# Altium schematic sheet Carrier_Board_real.SchDoc
size 381 x 304 mm; SheetNumber: 1; SheetTotal: 1
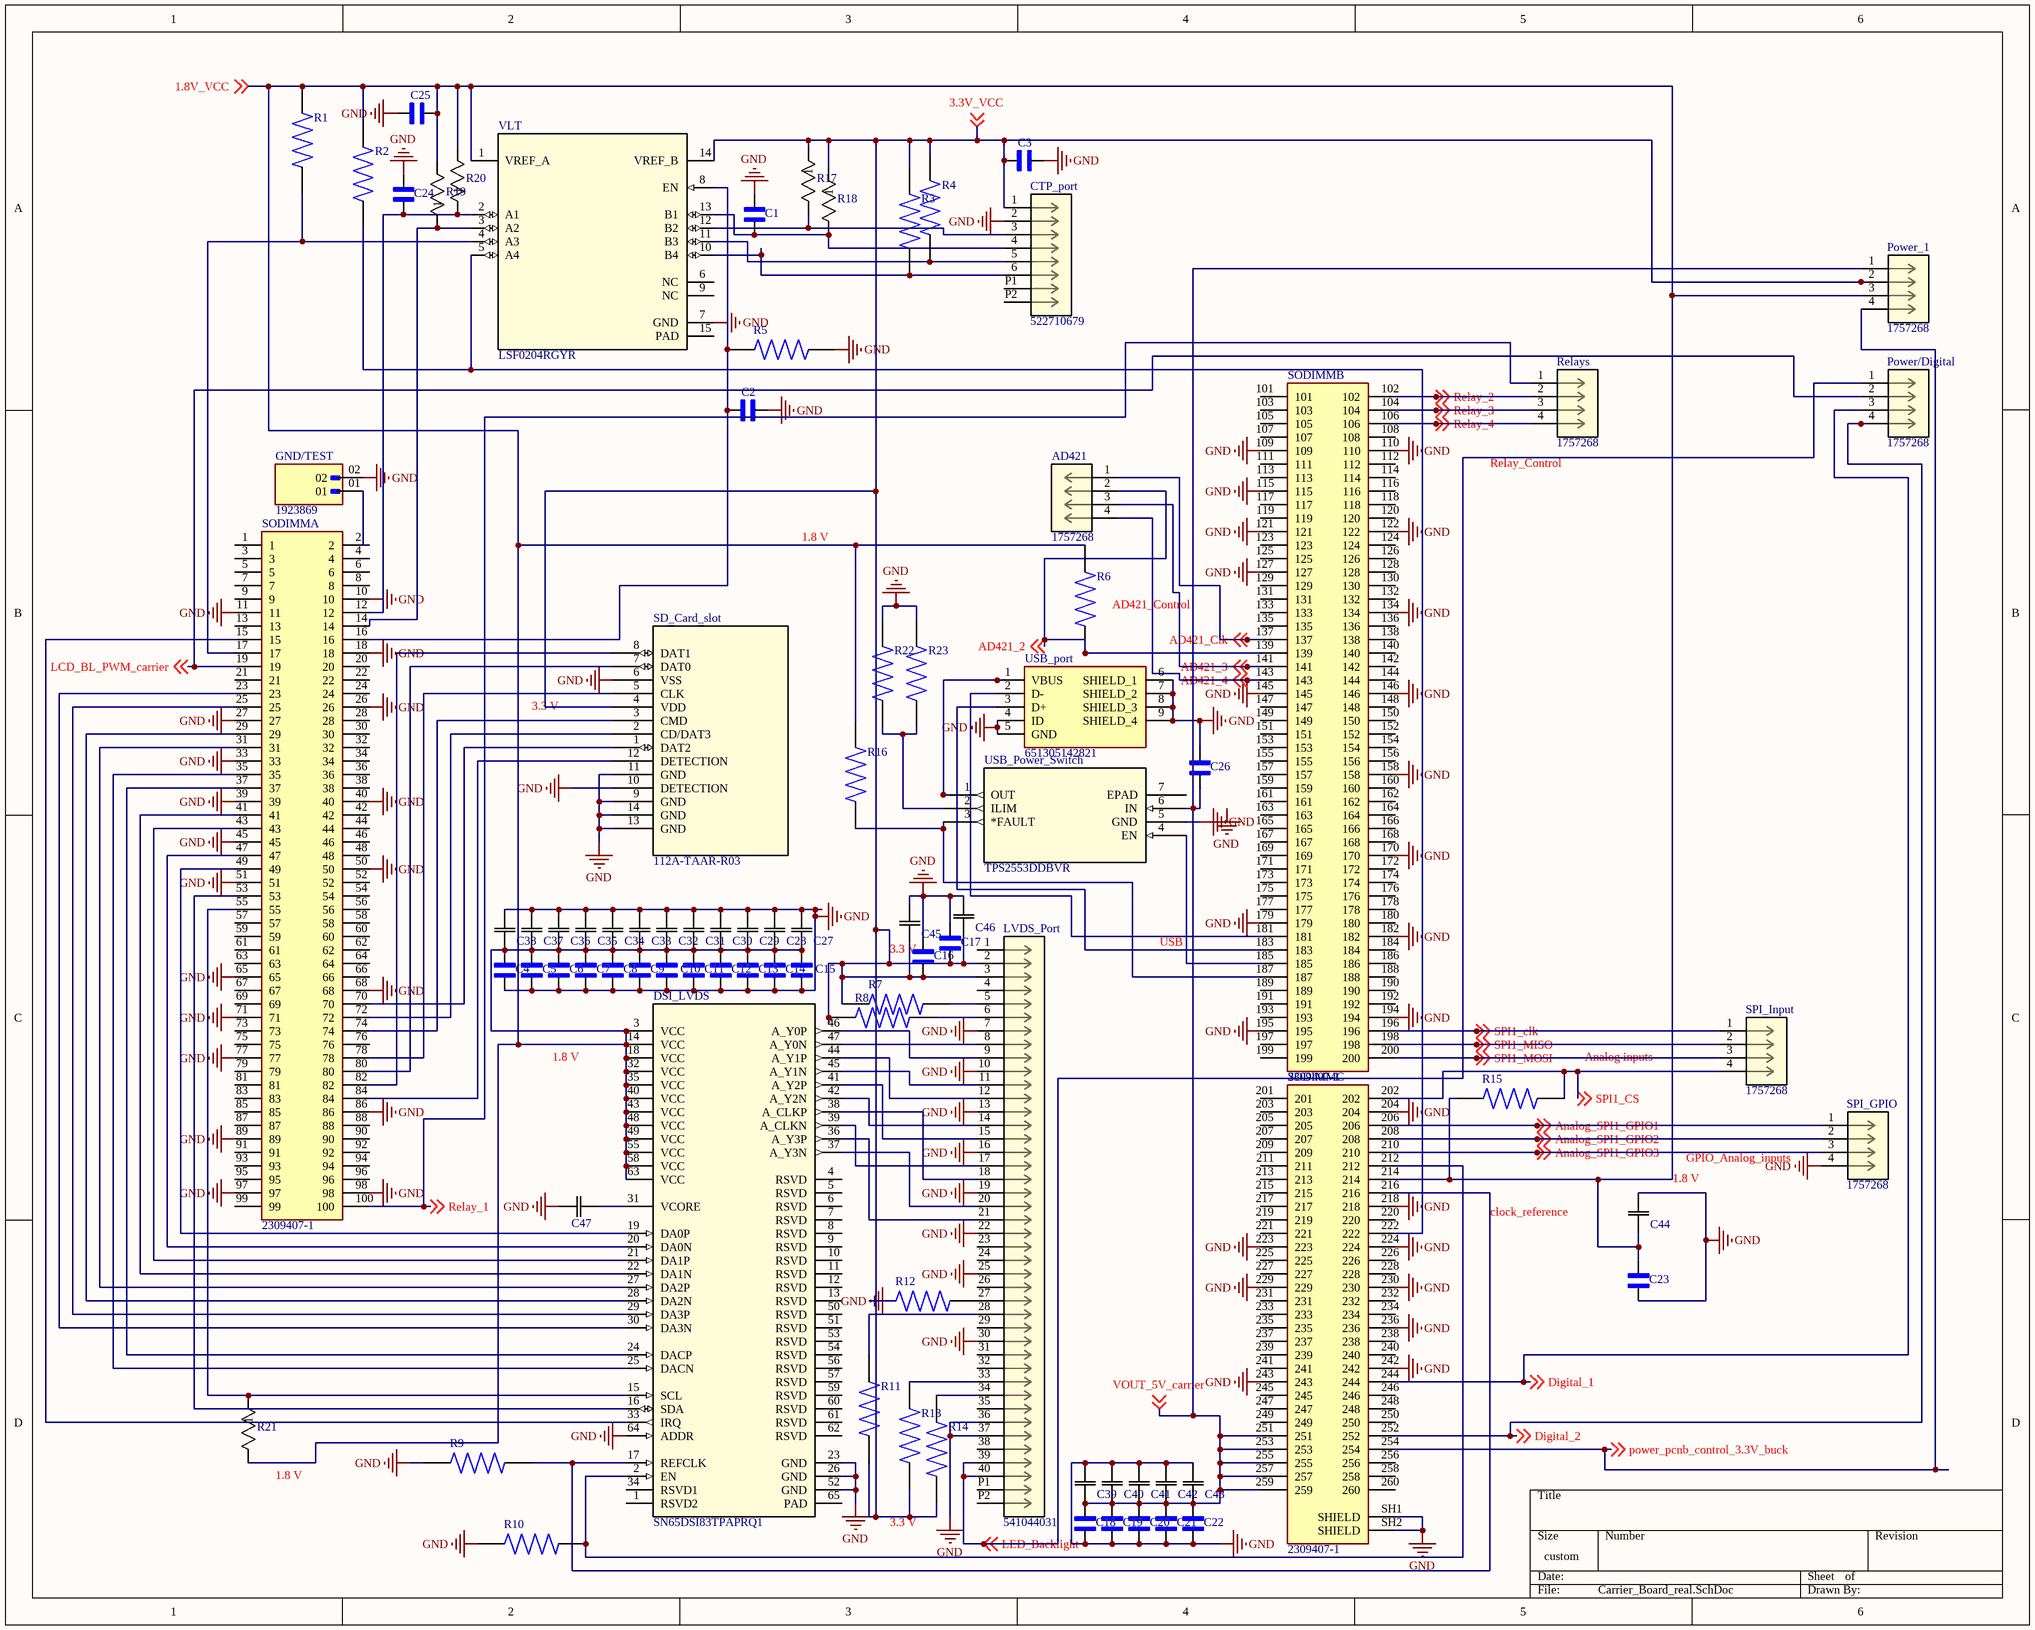
[diagram p0: Carrier_Board_real.SchDoc]

## Parts
AD421  1757268  [CONN_1757268_PXC]
C1  100n  [CAPC1608X90]  (value not drawn)
C2  100n  [CAPC1608X90]  (value not drawn)
C3  100n  [CAPC1608X90]  (value not drawn)
C4  100n  [CAPC1608X90]  (value not drawn)
C5  100n  [CAPC1608X90]  (value not drawn)
C6  100n  [CAPC1608X90]  (value not drawn)
C7  100n  [CAPC1608X90]  (value not drawn)
C8  100n  [CAPC1608X90]  (value not drawn)
C9  100n  [CAPC1608X90]  (value not drawn)
C10  100n  [CAPC1608X90]  (value not drawn)
C11  100n  [CAPC1608X90]  (value not drawn)
C12  100n  [CAPC1608X90]  (value not drawn)
C13  100n  [CAPC1608X90]  (value not drawn)
C14  100n  [CAPC1608X90]  (value not drawn)
C15  100n  [CAPC1608X90]  (value not drawn)
C16  100n  [CAPC1608X90]  (value not drawn)
C17  100n  [CAPC1608X90]  (value not drawn)
C18  100n  [CAPC1608X90]  (value not drawn)
C19  100n  [CAPC1608X90]  (value not drawn)
C20  100n  [CAPC1608X90]  (value not drawn)
C21  100n  [CAPC1608X90]  (value not drawn)
C22  100n  [CAPC1608X90]  (value not drawn)
C23  100n  [CAPC1608X90]  (value not drawn)
C24  100n  [CAPC1608X90]  (value not drawn)
C25  100n  [CAPC1608X90]  (value not drawn)
C26  100n  [CAPC1608X90]  (value not drawn)
C27  10u  [CAP_2012_TDK]  (value not drawn)
C28  10u  [CAP_2012_TDK]  (value not drawn)
C29  10u  [CAP_2012_TDK]  (value not drawn)
C30  10u  [CAP_2012_TDK]  (value not drawn)
C31  10u  [CAP_2012_TDK]  (value not drawn)
C32  10u  [CAP_2012_TDK]  (value not drawn)
C33  10u  [CAP_2012_TDK]  (value not drawn)
C34  10u  [CAP_2012_TDK]  (value not drawn)
C35  10u  [CAP_2012_TDK]  (value not drawn)
C36  10u  [CAP_2012_TDK]  (value not drawn)
C37  10u  [CAP_2012_TDK]  (value not drawn)
C38  10u  [CAP_2012_TDK]  (value not drawn)
C39  10u  [CAP_2012_TDK]  (value not drawn)
C40  10u  [CAP_2012_TDK]  (value not drawn)
C41  10u  [CAP_2012_TDK]  (value not drawn)
C42  10u  [CAP_2012_TDK]  (value not drawn)
C43  10u  [CAP_2012_TDK]  (value not drawn)
C44  10u  [CAP_2012_TDK]  (value not drawn)
C45  10u  [CAP_2012_TDK]  (value not drawn)
C46  10u  [CAP_2012_TDK]  (value not drawn)
C47  1u  [CAPC17595_90N_KEM]  (value not drawn)
CTP_port  522710679  [CON_522710679_MOL]
DSI_LVDS  SN65DSI83TPAPRQ1  [PAP0064Q_N]
GND/TEST  1923869  [PHOENIX_1923869]
LVDS_Port  541044031  [CON_541044031_MOL]
Power/Digital  1757268  [CONN_1757268_PXC]
Power_1  1757268  [CONN_1757268_PXC]
R1  10k  [RESC2012X60N]  (value not drawn)
R2  10k  [RESC2012X60N]  (value not drawn)
R3  10k  [RESC2012X60N]  (value not drawn)
R4  10k  [RESC2012X60N]  (value not drawn)
R5  10k  [RESC2012X60N]  (value not drawn)
R6  10k  [RESC2012X60N]  (value not drawn)
R7  10k  [RESC2012X60N]  (value not drawn)
R8  10k  [RESC2012X60N]  (value not drawn)
R9  10k  [RESC2012X60N]  (value not drawn)
R10  10k  [RESC2012X60N]  (value not drawn)
R11  10k  [RESC2012X60N]  (value not drawn)
R12  10k  [RESC2012X60N]  (value not drawn)
R13  10k  [RESC2012X60N]  (value not drawn)
R14  10k  [RESC2012X60N]  (value not drawn)
R15  10k  [RESC2012X60N]  (value not drawn)
R16  10k  [RESC2012X60N]  (value not drawn)
R17  4.7k  [RES_RC0805_YAG]  (value not drawn)
R18  4.7k  [RES_RC0805_YAG]  (value not drawn)
R19  4.7k  [RES_RC0805_YAG]  (value not drawn)
R20  4.7k  [RES_RC0805_YAG]  (value not drawn)
R21  4.7k  [RES_RC0805_YAG]  (value not drawn)
R22  100k  [RESC1608X55N]  (value not drawn)
R23  100k  [RESC1608X55N]  (value not drawn)
Relays  1757268  [CONN_1757268_PXC]
SD_Card_slot  112A-TAAR-R03  [CONN8_-TAAR-R03_ATT]
SODIMM  2309407-1  [TE_2309407-1]  (parts A,B,C of 3)
SPI_GPIO  1757268  [CONN_1757268_PXC]
SPI_Input  1757268  [CONN_1757268_PXC]
USB_port  651305142821  [651305142821]
USB_Power_Switch  TPS2553DDBVR  [DRV6_1P6X1_TEX]
VLT  LSF0204RGYR  [RGY0014A]

## Nets
GND: C1.1 C2.1 C3.1 C4.2 C5.2 C6.2 C7.2 C8.2 C9.2 C10.2 C11.2 C12.2 C13.2 C14.2 C15.2 C16.1 C17.1 C18.2 C19.2 C20.2 C21.2 C22.2 C23.2 C24.1 C25.1 C26.1 C27.2 C28.2 C29.2 C30.2 C31.2 C32.2 C33.2 C34.2 C35.2 C36.2 C37.2 C38.2 C39.2 C40.2 C41.2 C42.2 C43.2 C44.2 C45.2 C46.2 C47.1 CTP_port.2 DSI_LVDS.23(GND) DSI_LVDS.26(GND) DSI_LVDS.52(GND) DSI_LVDS.64(ADDR) GND/TEST.02 LVDS_Port.7 LVDS_Port.10 LVDS_Port.13 LVDS_Port.16 LVDS_Port.19 LVDS_Port.22 LVDS_Port.25 LVDS_Port.30 LVDS_Port.36 LVDS_Port.37 R5.2 R9.1 R10.1 R12.1 R22.2 R23.2 SD_Card_slot.6(VSS) SD_Card_slot.9(GND) SD_Card_slot.10(DETECTION) SD_Card_slot.11(GND) SD_Card_slot.13(GND) SD_Card_slot.14(GND) SODIMM.10 SODIMM.11 SODIMM.18 SODIMM.26 SODIMM.27 SODIMM.33 SODIMM.39 SODIMM.40 SODIMM.45 SODIMM.50 SODIMM.51 SODIMM.65 SODIMM.68 SODIMM.71 SODIMM.77 SODIMM.86 SODIMM.89 SODIMM.97 SODIMM.98 SODIMM.109 SODIMM.110 SODIMM.115 SODIMM.121 SODIMM.122 SODIMM.127 SODIMM.134 SODIMM.145 SODIMM.146 SODIMM.158 SODIMM.170 SODIMM.179 SODIMM.182 SODIMM.194 SODIMM.195 SODIMM.204 SODIMM.218 SODIMM.223 SODIMM.224 SODIMM.229 SODIMM.230 SODIMM.236 SODIMM.242 SODIMM.243 SODIMM.SH1(SHIELD) SODIMM.SH2(SHIELD) SPI_GPIO.4 USB_port.4(ID) USB_port.5(GND) USB_port.6(SHIELD_1) USB_port.7(SHIELD_2) USB_port.8(SHIELD_3) USB_port.9(SHIELD_4) USB_Power_Switch.5(GND) VLT.7(GND)
1.8V_VCC: C4.1 C5.1 C6.1 C7.1 C8.1 C9.1 C10.1 C11.1 C12.1 C13.1 C14.1 C15.1 C23.1 C25.2 C27.1 C28.1 C29.1 C30.1 C31.1 C32.1 C33.1 C34.1 C35.1 C36.1 C37.1 C38.1 C44.1 DSI_LVDS.3(VCC) DSI_LVDS.14(VCC) DSI_LVDS.18(VCC) DSI_LVDS.32(VCC) DSI_LVDS.35(VCC) DSI_LVDS.40(VCC) DSI_LVDS.43(VCC) DSI_LVDS.48(VCC) DSI_LVDS.49(VCC) DSI_LVDS.55(VCC) DSI_LVDS.58(VCC) DSI_LVDS.63(VCC) Power_1.3 R1.2 R2.2 R6.2 R15.1 R16.2 R19.2 R20.2 R21.2 SODIMM.214 VLT.1(VREF_A) ; off-sheet 1.8V_VCC
3.3V_VCC: C3.2 C16.2 C17.2 C45.1 C46.1 CTP_port.1 LVDS_Port.2 LVDS_Port.3 Power_1.2 R3.2 R4.2 R7.1 R8.1 R11.1 R13.1 R14.1 R17.1 R18.1 SD_Card_slot.4(VDD) VLT.14(VREF_B) ; off-sheet 3.3V_VCC
AD421_2: AD421.2 R6.1 SODIMM.139 ; off-sheet AD421_2
AD421_3: AD421.3 SODIMM.141 ; off-sheet AD421_3
AD421_4: AD421.4 SODIMM.143 ; off-sheet AD421_4
AD421_Clk: AD421.1 SODIMM.137 ; off-sheet AD421_Clk
Analog_SPI1_GPIO1: SODIMM.206 SPI_GPIO.1 ; off-sheet Analog_SPI1_GPIO1
Analog_SPI1_GPIO2: SODIMM.208 SPI_GPIO.2 ; off-sheet Analog_SPI1_GPIO2
Analog_SPI1_GPIO3: SODIMM.210 SPI_GPIO.3 ; off-sheet Analog_SPI1_GPIO3
Digital_1: Power/Digital.3 SODIMM.244 ; off-sheet Digital_1
Digital_2: Power/Digital.4 SODIMM.252 ; off-sheet Digital_2
LCD_BL_PWM_carrier: Power/Digital.2 SODIMM.19 ; off-sheet LCD_BL_PWM_carrier
LED_Backlight: LVDS_Port.39 LVDS_Port.40 Power/Digital.1 ; off-sheet LED_Backlight
power_pcnb_control_3.3V_buck: Power_1.4 SODIMM.254 ; off-sheet power_pcnb_control_3.3V_buck
Relay_1: Relays.1 SODIMM.100 ; off-sheet Relay_1
Relay_2: Relays.2 SODIMM.102 ; off-sheet Relay_2
Relay_3: Relays.3 SODIMM.104 ; off-sheet Relay_3
Relay_4: Relays.4 SODIMM.106 ; off-sheet Relay_4
SPI1_clk: SODIMM.196 SPI_Input.1 ; off-sheet SPI1_clk
SPI1_CS: R15.2 SODIMM.202 SPI_Input.4 ; off-sheet SPI1_CS
SPI1_MISO: SODIMM.198 SPI_Input.2 ; off-sheet SPI1_MISO
SPI1_MOSI: SODIMM.200 SPI_Input.3 ; off-sheet SPI1_MOSI
VOUT_5V_carrier: C18.1 C19.1 C20.1 C21.1 C22.1 C26.2 C39.1 C40.1 C41.1 C42.1 C43.1 Power_1.1 SODIMM.251 SODIMM.253 SODIMM.255 SODIMM.257 SODIMM.259 USB_Power_Switch.6(IN) ; off-sheet VOUT_5V_carrier
NetC1_2: C1.2 CTP_port.4 R18.2 VLT.13(B1)
NetC2_2: C2.2 R5.1 SODIMM.16 VLT.8(EN)
NetC24_2: C24.2 R20.1 SODIMM.12 VLT.2(A1)
NetC47_2: C47.2 DSI_LVDS.31(VCORE)
NetCTP_port_3: CTP_port.3 R17.2 VLT.12(B2)
NetCTP_port_5: CTP_port.5 R4.1 VLT.11(B3)
NetCTP_port_6: CTP_port.6 R3.1 VLT.10(B4)
NetDSI_LVDS_2: DSI_LVDS.2(EN) R10.2 SODIMM.212
NetDSI_LVDS_15: DSI_LVDS.15(SCL) R21.1 SODIMM.55
NetDSI_LVDS_16: DSI_LVDS.16(SDA) SODIMM.53
NetDSI_LVDS_17: DSI_LVDS.17(REFCLK) R9.2 SODIMM.216
NetDSI_LVDS_19: DSI_LVDS.19(DA0P) SODIMM.49
NetDSI_LVDS_20: DSI_LVDS.20(DA0N) SODIMM.47
NetDSI_LVDS_21: DSI_LVDS.21(DA1P) SODIMM.43
NetDSI_LVDS_22: DSI_LVDS.22(DA1N) SODIMM.41
NetDSI_LVDS_24: DSI_LVDS.24(DACP) SODIMM.37
NetDSI_LVDS_25: DSI_LVDS.25(DACN) SODIMM.35
NetDSI_LVDS_27: DSI_LVDS.27(DA2P) SODIMM.31
NetDSI_LVDS_28: DSI_LVDS.28(DA2N) SODIMM.29
NetDSI_LVDS_29: DSI_LVDS.29(DA3P) SODIMM.25
NetDSI_LVDS_30: DSI_LVDS.30(DA3N) SODIMM.23
NetDSI_LVDS_33: DSI_LVDS.33(IRQ) SODIMM.15
NetDSI_LVDS_36: DSI_LVDS.36(A_Y3P) LVDS_Port.21
NetDSI_LVDS_37: DSI_LVDS.37(A_Y3N) LVDS_Port.20
NetDSI_LVDS_38: DSI_LVDS.38(A_CLKP) LVDS_Port.18
NetDSI_LVDS_39: DSI_LVDS.39(A_CLKN) LVDS_Port.17
NetDSI_LVDS_41: DSI_LVDS.41(A_Y2P) LVDS_Port.15
NetDSI_LVDS_42: DSI_LVDS.42(A_Y2N) LVDS_Port.14
NetDSI_LVDS_44: DSI_LVDS.44(A_Y1P) LVDS_Port.12
NetDSI_LVDS_45: DSI_LVDS.45(A_Y1N) LVDS_Port.11
NetDSI_LVDS_46: DSI_LVDS.46(A_Y0P) LVDS_Port.9
NetDSI_LVDS_47: DSI_LVDS.47(A_Y0N) LVDS_Port.8
NetGND/TEST_01: GND/TEST.01 SODIMM.2
NetLVDS_Port_5: LVDS_Port.5 R7.2
NetLVDS_Port_6: LVDS_Port.6 R8.2
NetLVDS_Port_27: LVDS_Port.27 R12.2
NetLVDS_Port_28: LVDS_Port.28 R11.2
NetLVDS_Port_33: LVDS_Port.33 R13.2
NetLVDS_Port_34: LVDS_Port.34 R14.2
NetR1_1: R1.1 SODIMM.17 VLT.4(A3)
NetR2_1: R2.1 SODIMM.222 VLT.5(A4)
NetR16_1: R16.1 SODIMM.187 USB_Power_Switch.3(*FAULT)
NetR19_1: R19.1 SODIMM.14 VLT.3(A2)
NetR22_1: R22.1 R23.1 USB_Power_Switch.2(ILIM)
NetSD_Card_slot_1: SD_Card_slot.1(DAT2) SODIMM.70
NetSD_Card_slot_2: SD_Card_slot.2(CD/DAT3) SODIMM.72
NetSD_Card_slot_3: SD_Card_slot.3(CMD) SODIMM.74
NetSD_Card_slot_5: SD_Card_slot.5(CLK) SODIMM.78
NetSD_Card_slot_7: SD_Card_slot.7(DAT0) SODIMM.80
NetSD_Card_slot_8: SD_Card_slot.8(DAT1) SODIMM.82
NetSD_Card_slot_12: SD_Card_slot.12(DETECTION) SODIMM.84
NetSODIMM_181: SODIMM.181 USB_port.2(D-)
NetSODIMM_183: SODIMM.183 USB_port.3(D+)
NetSODIMM_185: SODIMM.185 USB_Power_Switch.4(EN)
NetUSB_port_1: USB_port.1(VBUS) USB_Power_Switch.1(OUT)

Not connected (* = marked no-connect by the designer): CTP_port P1 P2; DSI_LVDS 1(RSVD2) 4(RSVD) 5(RSVD) 6(RSVD) 7(RSVD) 8(RSVD) 9(RSVD) 10(RSVD) 11(RSVD) 12(RSVD) 13(RSVD) 34(RSVD1) 50(RSVD) 51(RSVD) 53(RSVD) 54(RSVD) 56(RSVD) 57(RSVD) 59(RSVD) 60(RSVD) 61(RSVD) 62(RSVD) 65(PAD); LVDS_Port 1 4 23 24 26 29 31 32 35 38 P1 P2; SODIMM 1 3 4 5 6 7 8 9 13 20 21 22 24 28 30 32 34 36 38 42 44 46 48 52 54 56 57 58 59 60 61 62 63 64 66 67 69 73 75 76 79 81 83 85 87 88 90 91 92 93 94 95 96 99 101 103 105 107 108 111 112 113 114 116 117 118 119 120 123 124 125 126 128 129 130 131 132 133 135 136 138 140 142 144 147 148 149 150 151 152 153 154 155 156 157 159 160 161 162 163 164 165 166 167 168 169 171 172 173 174 175 176 177 178 180 184 186 188 189 190 191 192 193 197 199 201 203 205 207 209 211 213 215 217 219 220 221 225 226 227 228 231 232 233 234 235 237 238 239 240 241 245 246 247 248 249 250 256 258 260; USB_Power_Switch 7(EPAD); VLT 6(NC) 9(NC) 15(PAD)

## Notes on the sheet
- (near Relays) Relay_Control
- 1.8 V
- (near R6) AD421_Control
- 3.3 V
- (near C16) 3.3 V
- USB
- Analog inputs
- GPIO_Analog_inputs
- clock_reference
- (near C44) 1.8 V
- (near R21) 1.8 V
- Labels drawn without touching a wire or pin: GND

## Library data of the parts
AD421 Power/Digital Power_1 Relays SPI_GPIO SPI_Input = CMP-085-000000-1: p; Manufacturer_Name: Phoenix Contact; RefDes: RefDes; Type: Type; Source: 1757268.SchLib; Design Item ID: 1757268; Manufacturer_Part_Number: 1757268; Copyright: Copyright (C) 2026 Ultra Librarian. All rights reserved.
C1-C26 = CMP-001-00083-1: Capacitor, Ceramic, Cap, .100uF, Tol 10%, SMT, 16V, X7R; MF: KEMET; Source: C0603C104K4RACTU.SchLib; Pins: 2; SnapEDA_Link: https://www.snapeda.com/parts/C0603C104K4RACTU/KEMET/view-part/?ref=snap; MP: C0603C104K4RACTU; Check_prices: https://www.snapeda.com/parts/C0603C104K4RACTU/KEMET/view-part/?ref=eda; Component Type: Standard; Case/Package: 603-2 KEMET; Design Item ID: C0603C104K4RACTU
C27-C46 = CMP-001-00096-1: Description; Manufacturer_Name: TDK; Manufacturer_Part_Number: C2012X6S1C106K085AC; Design Item ID: C2012X6S1C106K085AC; Source: C2012X6S1C106K085AC.SchLib; Copyright: Copyright (C) 2025 Ultra Librarian. All rights reserved.
C47 = CMP-001-00086-1: SMD Comm X7R, Ceramic, 1 uF, 10%, 16 VDC, X7R, SMD, MLCC, Temperature Stable, Class II, 0603; Manufacturer_Name: Kemet; Design Item ID: C0603C105K4RACTU; Source: C0603C105K4RACTU.SchLib; Copyright: Copyright (C) 2026 Ultra Librarian. All rights reserved.; Manufacturer_Part_Number: C0603C105K4RACTU
CTP_port = CMP-002-00081-1: Easy-On FFC/FPC Connector, 1.00mm Pitch, Slider Series, Right-Angle, Bottom Contact, 3.00mm Height, 6 Circuits, Tin-Bismuth Plating; Manufacturer_Name: Molex Connector Corporation; Design Item ID: 522710679; Manufacturer_Part_Number: 522710679; Copyright: Copyright (C) 2026 Ultra Librarian. All rights reserved.; Type: Type; Source: 522710679.SchLib; RefDes: RefDes
DSI_LVDS = CMP-044-000000-1: Automotive single-channel MIPIÂ® DSI to single-link LVDS bridge 64-HTQFP -40 to 105; Manufacturer_Name: Texas Instruments; Copyright: Copyright (C) 2025 Ultra Librarian. All rights reserved.; RefDes: RefDes; Source: SN65DSI83TPAPRQ1.SchLib; Design Item ID: SN65DSI83TPAPRQ1; TYPE: TYPE; Manufacturer_Part_Number: SN65DSI83TPAPRQ1
GND/TEST = CMP-002-00074-1: Pluggable Header 5.08mm 12AWG 320V 16A 2 Position Combicon Power Series; MF: Phoenix Contact; MP: 1923869; Pins: 2; SnapEDA_Link: https://www.snapeda.com/parts/1923869/Phoenix+Contact/view-part/?ref=snap; Source: 1923869.SchLib; Design Item ID: 1923869; Component Type: Standard; Check_prices: https://www.snapeda.com/parts/1923869/Phoenix+Contact/view-part/?ref=eda; Case/Package: None; Value: *
LVDS_Port = CMP-002-00084-1: Easy-On FFC/FPC Connector, 0.50mm Pitch, Slider Series, Right-Angle, Top  Contact, 2.00mm Height, 40 Circuits, Gold Plating; Manufacturer_Name: Molex Connector Corporation; RefDes: RefDes; Manufacturer_Part_Number: 541044031; Design Item ID: 541044031; Source: 541044031.SchLib; Type: Type; Copyright: Copyright (C) 2025 Ultra Librarian. All rights reserved.
R1-R16 = CMP-009-00177-1: 10 kOhms Â±0.1% 0.125W, 1/8W Chip Resistor 0805 (2012 Metric) - Thin Film; MF: Yageo; Check_prices: https://www.snapeda.com/parts/RT0805BRD0710KL/Yageo/view-part/?ref=eda; SnapEDA_Link: https://www.snapeda.com/parts/RT0805BRD0710KL/Yageo/view-part/?ref=snap; Design Item ID: RT0805BRD0710KL; Source: RT0805BRD0710KL.SchLib; Case/Package: 2012 Yageo; Pins: 2; Component Type: Standard; MP: RT0805BRD0710KL
R17-R21 = CMP-009-00179-1: RES SMD 4.7 k? 1% 1/8W 0805; Manufacturer_Name: Yageo; Design Item ID: RC0805FR-074K7L; Manufacturer_Part_Number: RC0805FR-074K7L; Source: RC0805FR-074K7L.SchLib; Copyright: Copyright (C) 2025 Ultra Librarian. All rights reserved.
R22 R23 = CMP-009-00181-1: 100 kOhms Â±1% 0.25W, 1/4W Chip Resistor 0603 (1608 Metric) Automotive AEC-Q200, Pulse Withstanding Thick Film; MF: TE Connectivity; Component Type: Standard; SnapEDA_Link: https://www.snapeda.com/parts/CRGP0603F100K/TE+Connectivity/view-part/?ref=snap; Design Item ID: CRGP0603F100K; Pins: 2; Case/Package: 0603-2 TE Connectivity; MP: CRGP0603F100K; Source: CRGP0603F100K.SchLib; Check_prices: https://www.snapeda.com/parts/CRGP0603F100K/TE+Connectivity/view-part/?ref=eda
SD_Card_slot = CMP-041-000000-1: Description; Design Item ID: 112A-TAAR-R03; Copyright: Copyright (C) 2026 Ultra Librarian. All rights reserved.; Type: Type; Source: 112A-TAAR-R03.SchLib; RefDes: RefDes
SODIMM = CMP-002-00077-1: MP: 2309407-1; Component Type: Standard; Value: *; Pins: 262; Availability: Unavailable; Price: None; Case/Package: None; Source: 2309407-1.SchLib; Design Item ID: 2309407-1
USB_port = CMP-053-000000-1: WR-COM_USB_Mini Type AB_Horizontal_SMT Mini Type AB Horizontal SMT - with Pads; Manufacturer_Name: Wurth Elektronik; Geometry.Height: 4.15mm; Arrow Price/Stock: *; Arrow Part Number: *; Design Item ID: 651305142821; Manufacturer_Part_Number: 651305142821; Datasheet Link: https://www.we-online.com/catalog/datasheet/651305142821.pdf; Mouser Price/Stock: https://www.mouser.co.uk/ProductDetail/Wurth-Elektronik/651305142821?qs=7gQLVZk5cPlF7bfbuz8kNg%3D%3D; Mouser Part Number: 710-651305142821; Source: 651305142821.SchLib
USB_Power_Switch = CMP-011-00013-1: 0.075-1.7A adj. ILIMIT 2.5-6.5V 85m&Omega; USB power switch, active-high, reverse blocking, multi 6-SOT-23 -40 to 125; Manufacturer_Name: Texas Instruments; Design Item ID: TPS2553DDBVR; RefDes: RefDes; Source: TPS2553DDBVR.SchLib; Copyright: Copyright (C) 2025 Ultra Librarian. All rights reserved.; Type: Type; Manufacturer_Part_Number: TPS2553DDBVR
VLT = CMP-071-000000-1: 4-Bit Bidirectional Multi-Voltage Level Translator for Open-Drain & Push- Pull 14-VQFN -40 to 125; Manufacturer: Texas Instruments; CompType: IC; Application_BuildNumber: *; RefDes: RefDes; TYPE: TYPE; Datasheet: https://www.ti.com/lit/gpn/lsf0204; PackageReference: RGY0014A; Copyright: Copyright (C) 2026 Ultra Librarian. All rights reserved.; Manufacturer_Name: Texas Instruments; Source: LSF0204RGYR.SchLib; Design Item ID: LSF0204RGYR; MountType: SMT; Manufacturer_Part_Number: LSF0204RGYR; PartNumber: LSF0204RGYR; RoHS: Y